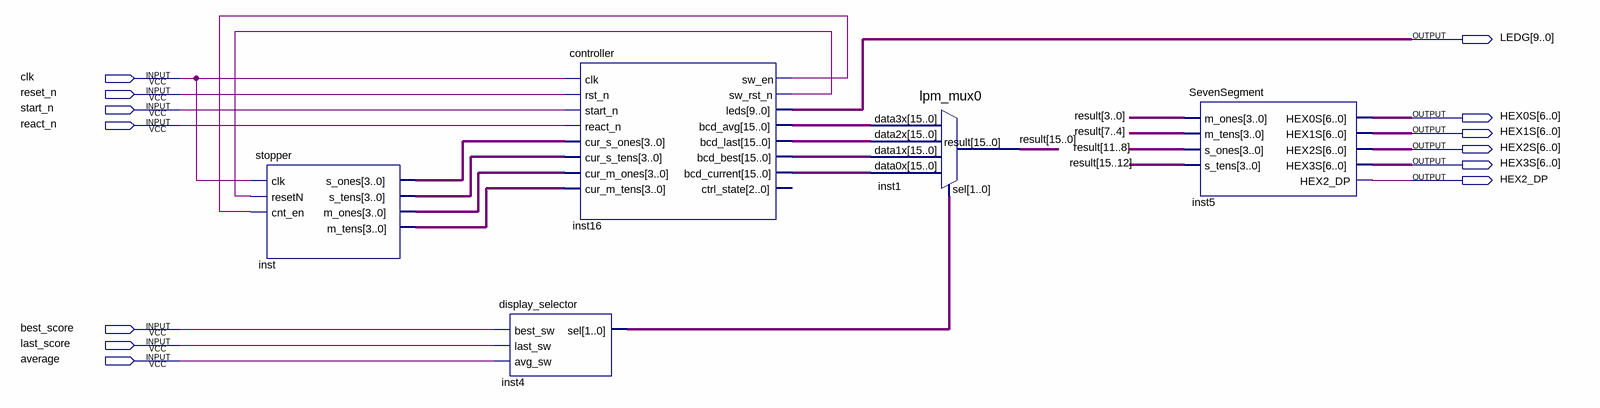
[diagram p0: schematic sheet]
// Quartus schematic main.bdf as structural Verilog: 5 symbols, 13 pins
module main (
  input  clk,
  input  reset_n,
  input  start_n,
  input  react_n,
  input  best_score,
  input  last_score,
  input  average,
  output [9:0] LEDG,
  output [6:0] HEX0S,
  output [6:0] HEX1S,
  output [6:0] HEX2S,
  output [6:0] HEX3S,
  output HEX2_DP
);

  wire inst16_sw_en, inst16_sw_rst_n;
  wire [1:0] inst4_sel;
  wire [3:0] inst_m_ones, inst_m_tens, inst_s_ones, inst_s_tens;
  wire [15:0] inst16_bcd_avg, inst16_bcd_best, inst16_bcd_current, inst16_bcd_last, result;

  stopper inst (
    .clk(clk), .resetN(inst16_sw_rst_n), .cnt_en(inst16_sw_en), .s_ones(inst_s_ones), .s_tens(inst_s_tens),
    .m_ones(inst_m_ones), .m_tens(inst_m_tens));
  display_selector inst4 (.best_sw(best_score), .last_sw(last_score), .avg_sw(average), .sel(inst4_sel));
  controller inst16 (
    .clk(clk), .rst_n(reset_n), .start_n(start_n), .react_n(react_n), .cur_s_ones(inst_s_ones),
    .cur_s_tens(inst_s_tens), .cur_m_ones(inst_m_ones), .cur_m_tens(inst_m_tens), .sw_en(inst16_sw_en),
    .sw_rst_n(inst16_sw_rst_n), .leds(LEDG), .bcd_avg(inst16_bcd_avg), .bcd_last(inst16_bcd_last),
    .bcd_best(inst16_bcd_best), .bcd_current(inst16_bcd_current));  // open: ctrl_state
  lpm_mux0 inst1 (
    .data3x(inst16_bcd_avg), .data2x(inst16_bcd_last), .data1x(inst16_bcd_best), .data0x(inst16_bcd_current),
    .sel(inst4_sel), .result(result));
  SevenSegment inst5 (
    .m_ones(result[3:0]), .m_tens(result[7:4]), .s_ones(result[11:8]), .s_tens(result[15:12]), .HEX0S(HEX0S),
    .HEX1S(HEX1S), .HEX2S(HEX2S), .HEX3S(HEX3S), .HEX2_DP(HEX2_DP));
endmodule
